# Altium project LSS_Gripper_Bottom_Board.PrjPcb (part 3 of 3)

## Sheet Motor-Driver-Sheet.SchDoc
size 420 x 297 mm; SheetNumber: 4; SheetTotal: 7
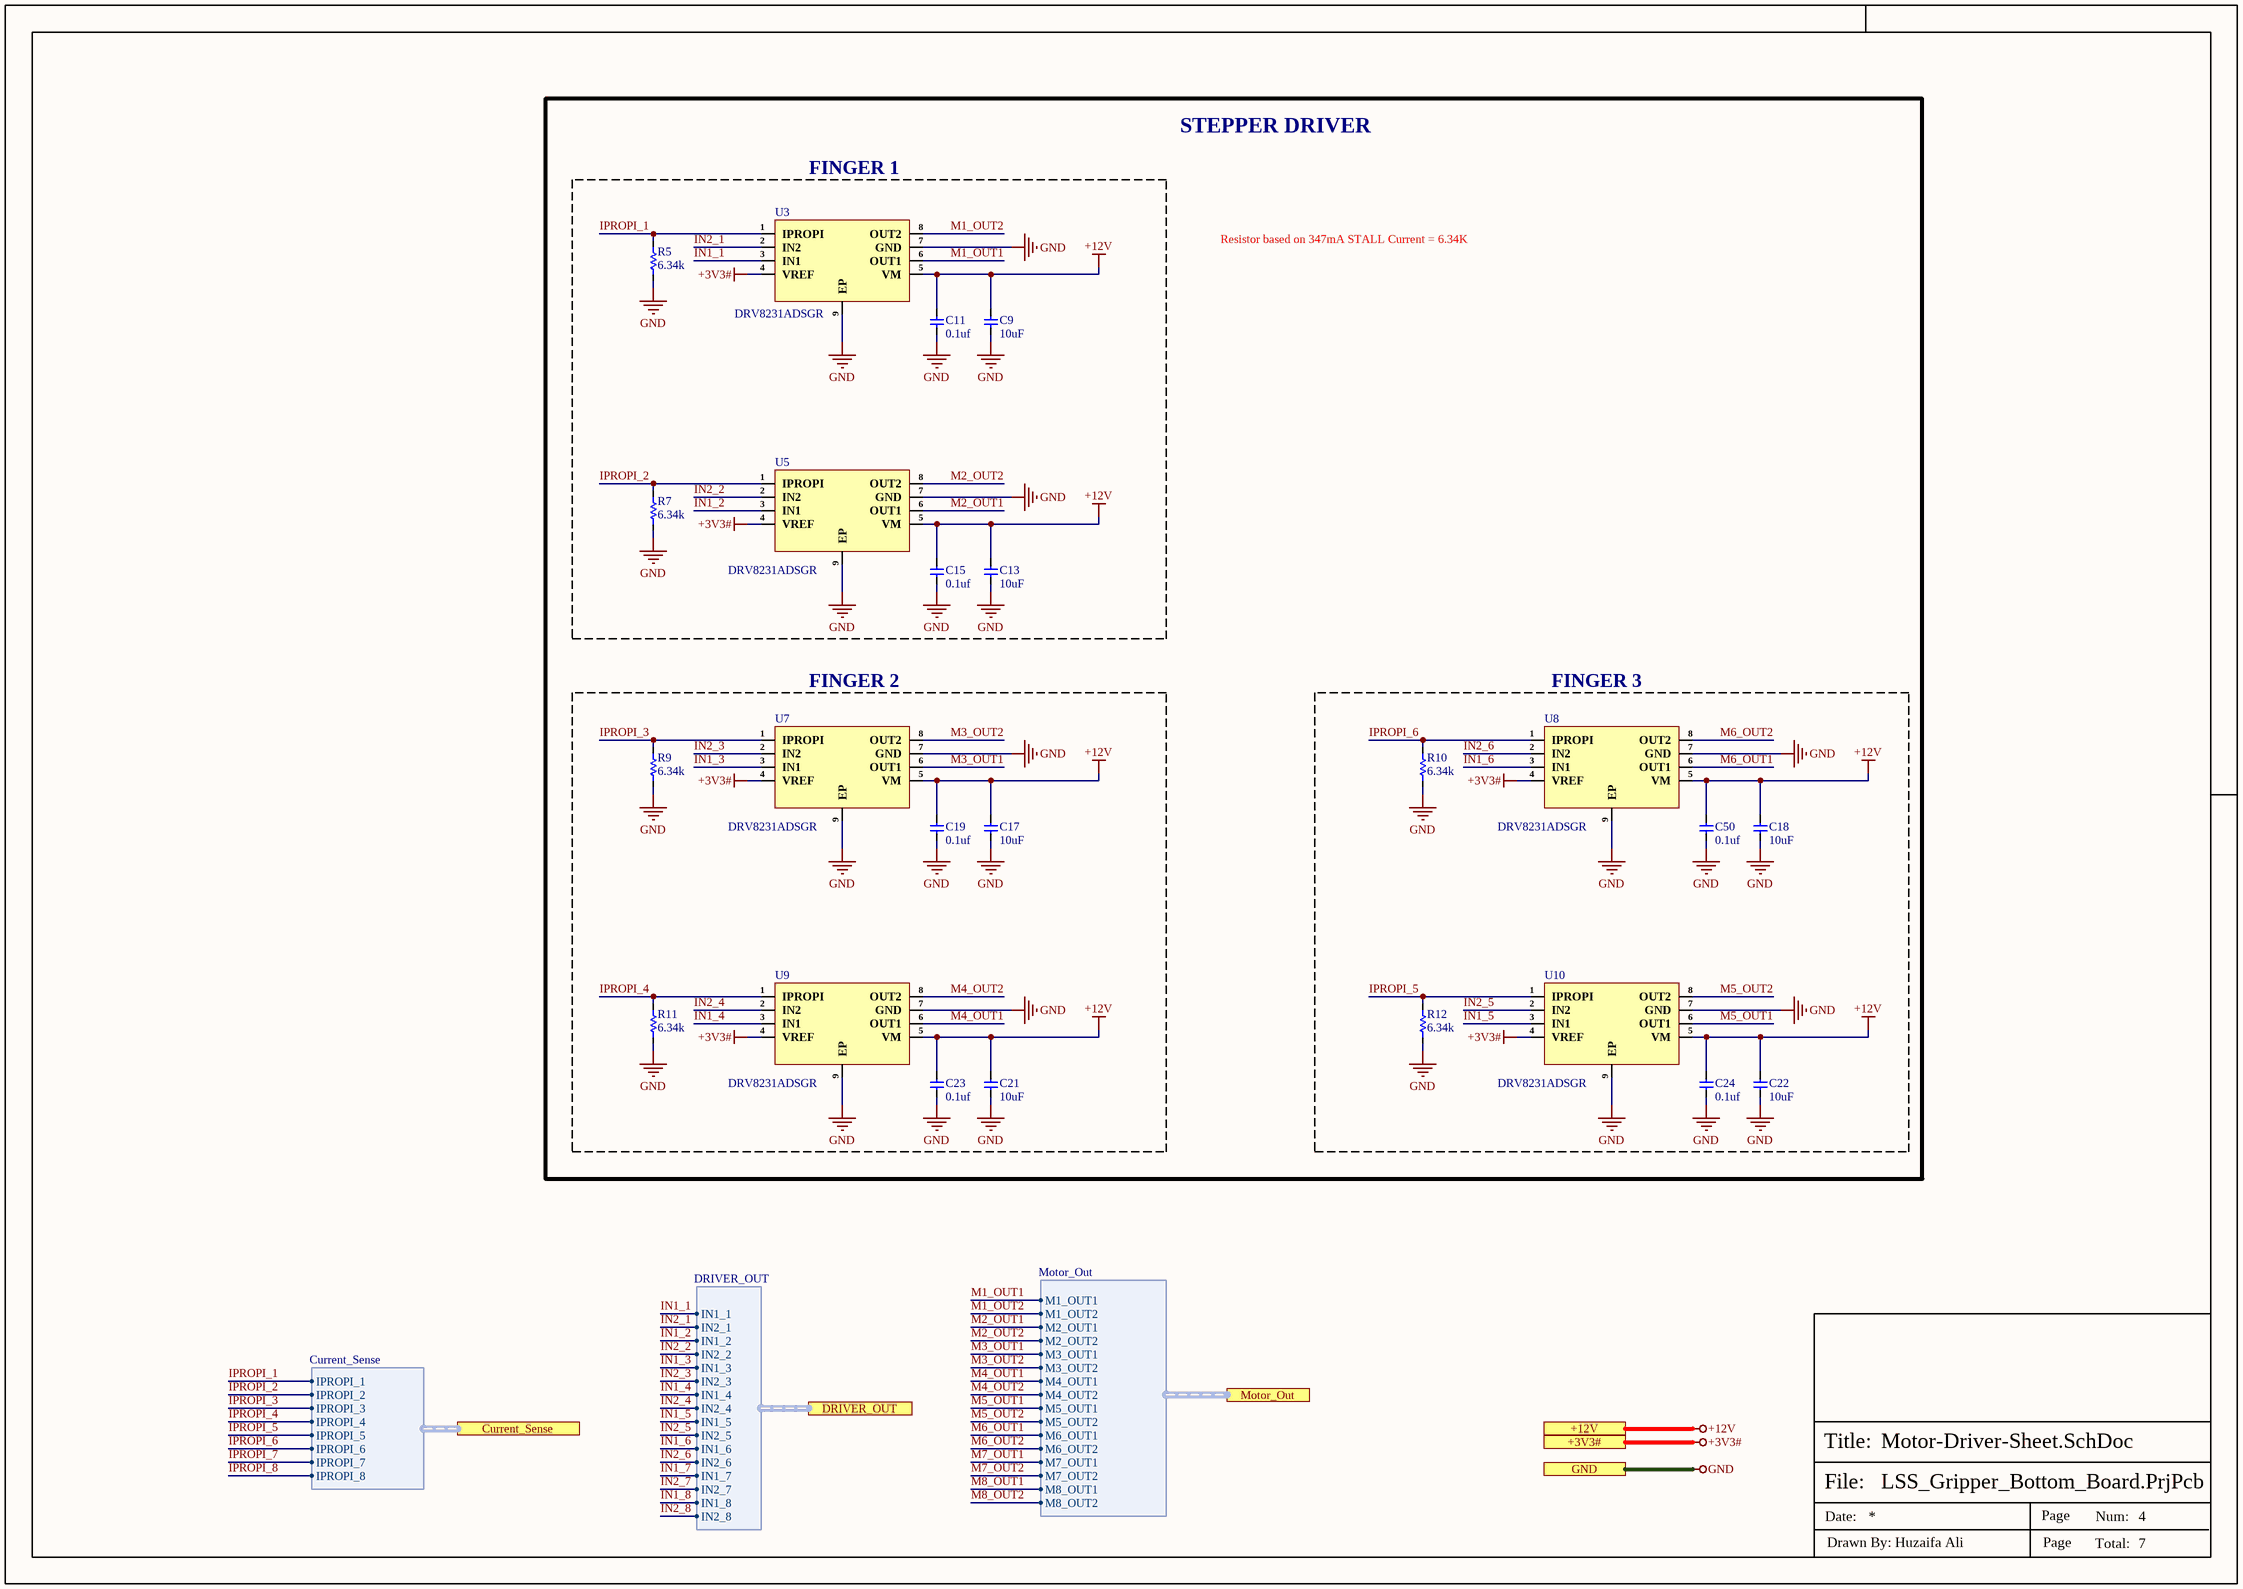
[diagram p6: Motor-Driver-Sheet.SchDoc]

### Parts
C9  10uF  [Cap-0603]
C11  0.1uf  [Cap-0402]
C13  10uF  [Cap-0603]
C15  0.1uf  [Cap-0402]
C17  10uF  [Cap-0603]
C18  10uF  [Cap-0603]
C19  0.1uf  [Cap-0402]
C21  10uF  [Cap-0603]
C22  10uF  [Cap-0603]
C23  0.1uf  [Cap-0402]
C24  0.1uf  [Cap-0402]
C50  0.1uf  [Cap-0402]
R5  6.34k  [Res-0603]
R7  6.34k  [Res-0603]
R9  6.34k  [Res-0603]
R10  6.34k  [Res-0603]
R11  6.34k  [Res-0603]
R12  6.34k  [Res-0603]
U3  DRV8231ADSGR  [WSON-8(2x2)]
U5  DRV8231ADSGR  [WSON-8(2x2)]
U7  DRV8231ADSGR  [WSON-8(2x2)]
U8  DRV8231ADSGR  [WSON-8(2x2)]
U9  DRV8231ADSGR  [WSON-8(2x2)]
U10  DRV8231ADSGR  [WSON-8(2x2)]

### Blocks framed on the sheet
FINGER 1: C9 C11 C13 C15 R5 R7 U3 U5
FINGER 2: C17 C19 C21 C23 R9 R11 U7 U9
FINGER 3: C18 C22 C24 C50 R10 R12 U8 U10

### Ports
+3V3# (see Top-Sheet[4B], CAN-Sheet[5D], Controller-Sheet[5D], Current-Sense-Sheet[5D]), +12V (see Top-Sheet[4B], Connector-Sheet[5D]), Current_Sense (harness Current_Sense, see Top-Sheet[5B], Current-Sense-Sheet[2D]), DRIVER_OUT (harness DRIVER_OUT, see Top-Sheet[4B], Controller-Sheet[2D]), GND (see Top-Sheet[4B], CAN-Sheet[5D], Connector-Sheet[5D], Controller-Sheet[5D], Current-Sense-Sheet[5D], Motor-Connector[5D]), Motor_Out (harness Motor_Out, see Top-Sheet[4B], Motor-Connector[4D])

### Harnesses
Current_Sense: IPROPI_1, IPROPI_2, IPROPI_3, IPROPI_4, IPROPI_5, IPROPI_6, IPROPI_7, IPROPI_8
Motor_Out: M1_OUT1, M1_OUT2, M2_OUT1, M2_OUT2, M3_OUT1, M3_OUT2, M4_OUT1, M4_OUT2, M5_OUT1, M5_OUT2, M6_OUT1, M6_OUT2, M7_OUT1, M7_OUT2, M8_OUT1, M8_OUT2
DRIVER_OUT: IN1_1, IN2_1, IN1_2, IN2_2, IN1_3, IN2_3, IN1_4, IN2_4, IN1_5, IN2_5, IN1_6, IN2_6, IN1_7, IN2_7, IN1_8, IN2_8

### Nets
+3V3#: U3.4(VREF) U5.4(VREF) U7.4(VREF) U8.4(VREF) U9.4(VREF) U10.4(VREF) ; port +3V3#
+12V: C9.2 C11.2 C13.2 C15.2 C17.2 C18.2 C19.2 C21.2 C22.2 C23.2 C24.2 C50.2 U3.5(VM) U5.5(VM) U7.5(VM) U8.5(VM) U9.5(VM) U10.5(VM) ; port +12V
GND: C9.1 C11.1 C13.1 C15.1 C17.1 C18.1 C19.1 C21.1 C22.1 C23.1 C24.1 C50.1 R5.1 R7.1 R9.1 R10.1 R11.1 R12.1 U3.7(GND) U3.9(EP) U5.7(GND) U5.9(EP) U7.7(GND) U7.9(EP) U8.7(GND) U8.9(EP) U9.7(GND) U9.9(EP) U10.7(GND) U10.9(EP) ; port GND
IPROPI_1: R5.2 U3.1(IPROPI) ; port Current_Sense.IPROPI_1
IPROPI_2: R7.2 U5.1(IPROPI) ; port Current_Sense.IPROPI_2
IPROPI_3: R9.2 U7.1(IPROPI) ; port Current_Sense.IPROPI_3
IPROPI_4: R11.2 U9.1(IPROPI) ; port Current_Sense.IPROPI_4
IPROPI_5: R12.2 U10.1(IPROPI) ; port Current_Sense.IPROPI_5
IPROPI_6: R10.2 U8.1(IPROPI) ; port Current_Sense.IPROPI_6
IN1_1: U3.3(IN1) ; port DRIVER_OUT.IN1_1
IN1_2: U5.3(IN1) ; port DRIVER_OUT.IN1_2
IN1_3: U7.3(IN1) ; port DRIVER_OUT.IN1_3
IN1_4: U9.3(IN1) ; port DRIVER_OUT.IN1_4
IN1_5: U10.3(IN1) ; port DRIVER_OUT.IN1_5
IN1_6: U8.3(IN1) ; port DRIVER_OUT.IN1_6
IN1_7: port DRIVER_OUT.IN1_7
IN1_8: port DRIVER_OUT.IN1_8
IN2_1: U3.2(IN2) ; port DRIVER_OUT.IN2_1
IN2_2: U5.2(IN2) ; port DRIVER_OUT.IN2_2
IN2_3: U7.2(IN2) ; port DRIVER_OUT.IN2_3
IN2_4: U9.2(IN2) ; port DRIVER_OUT.IN2_4
IN2_5: U10.2(IN2) ; port DRIVER_OUT.IN2_5
IN2_6: U8.2(IN2) ; port DRIVER_OUT.IN2_6
IN2_7: port DRIVER_OUT.IN2_7
IN2_8: port DRIVER_OUT.IN2_8
IPROPI_7: port Current_Sense.IPROPI_7
IPROPI_8: port Current_Sense.IPROPI_8
M1_OUT1: U3.6(OUT1) ; port Motor_Out.M1_OUT1
M1_OUT2: U3.8(OUT2) ; port Motor_Out.M1_OUT2
M2_OUT1: U5.6(OUT1) ; port Motor_Out.M2_OUT1
M2_OUT2: U5.8(OUT2) ; port Motor_Out.M2_OUT2
M3_OUT1: U7.6(OUT1) ; port Motor_Out.M3_OUT1
M3_OUT2: U7.8(OUT2) ; port Motor_Out.M3_OUT2
M4_OUT1: U9.6(OUT1) ; port Motor_Out.M4_OUT1
M4_OUT2: U9.8(OUT2) ; port Motor_Out.M4_OUT2
M5_OUT1: U10.6(OUT1) ; port Motor_Out.M5_OUT1
M5_OUT2: U10.8(OUT2) ; port Motor_Out.M5_OUT2
M6_OUT1: U8.6(OUT1) ; port Motor_Out.M6_OUT1
M6_OUT2: U8.8(OUT2) ; port Motor_Out.M6_OUT2
M7_OUT1: port Motor_Out.M7_OUT1
M7_OUT2: port Motor_Out.M7_OUT2
M8_OUT1: port Motor_Out.M8_OUT1
M8_OUT2: port Motor_Out.M8_OUT2

### Notes on the sheet
- STEPPER DRIVER
- Resistor based on 347mA STALL Current = 6.34K
- File:
- Title:
- Date:
- Page
- Num:
- Total:
- Drawn By: Huzaifa Ali

### Library data of the parts
C9 C13 C17 C18 C21 C22 = GRM188R61E106KA73D: CAP CER 10UF 25V X5R 0603; Manufacturer: Murata; Supplier 1: Mouser; Manufacturer Part Number: GRM188R61E106KA73D; RoHS: Yes; Category: Ceramic Capacitors; Stock 1: 319428; Pricing 1: 1=0.36000, 10=0.25800, 50=0.25800, 100=0.15500, 1000=0.09800, 10000=0.06900 (USD); Case/Package: 0603; RoHS Compliant: Yes; ComponentLink1URL: https://search.murata.co.jp/Ceramy/image/img/A01X/G101/ENG/GRM188R61E106KA73-01.pdf?src-supplier=Digi-Key; ComponentLink1Description: https://search.murata.co.jp/Ceramy/image/img/A01X/G101/ENG/GRM188R61E106KA73-01.pdf?src-supplier=Digi-Key; Supplier Part Number 1: 81-GRM188R61E106KA3D; LCSC Part Number: C344022
C11 C15 C19 C23 C24 C50 = GRM155R62A104KE14D: CAP CER 0.1UF 100V X5R 0402; Manufacturer: Murata; Capacitance: 100nF; Tolerance: 10%; Item Type: Capacitor; Supplier 1: Arrow Electronics; Manufacturer Part Number: GRM155R62A104KE14D; RoHS: Yes; Category: Ceramic Capacitors; Stock 1: 870000; Pricing 1: 10000=0.00500, 20000=0.00410, 30000=0.00390, 50000=0.00370, 100000=0.00300 (USD); Mount: Surface Mount; Case/Package: 0402; Case Code (Metric): 1005; Case Code (Imperial): 0402; Weight: 0.000212oz; Min Operating Temperature: -55°C; Max Operating Temperature: 85°C; Packaging: Tape and Reel; Voltage Rating: 100V; Dielectric: X5R; Termination: SMD/SMT; Voltage Rating (DC): 100V; Package Quantity: 10000; Series: GRM; Length: 0.039inch; Width: 0.02inch; Height: 0.5mm; Thickness: 0.022inch; Reach SVHC Compliant: Yes; Lead Free: Lead Free; RoHS Compliant: Yes; ComponentLink1URL: http://www.farnell.com/datasheets/2079151.pdf?src-supplier=Farnell; ComponentLink1Description: http://www.farnell.com/datasheets/2079151.pdf?src-supplier=Farnell; ComponentLink2URL: http://www.mouser.com/ds/2/281/c02e-2905.pdf?src-supplier=Mouser; ComponentLink2Description: http://www.mouser.com/ds/2/281/c02e-2905.pdf?src-supplier=Mouser; ComponentLink3URL: http://www.farnell.com/datasheets/2079151.pdf?src-supplier=Element14; ComponentLink3Description: http://www.farnell.com/datasheets/2079151.pdf?src-supplier=Element14; ComponentLink4URL: http://search.murata.co.jp/Ceramy/image/img/A01X/G101/ENG/GRM155R62A104KE14-01.pdf?src-supplier=Digi-Key; ComponentLink4Description: http://search.murata.co.jp/Ceramy/image/img/A01X/G101/ENG/GRM155R62A104KE14-01.pdf?src-supplier=Digi-Key; ComponentLink5URL: http://www.farnell.com/datasheets/2079151.pdf?src-supplier=Newark; ComponentLink5Description: http://www.farnell.com/datasheets/2079151.pdf?src-supplier=Newark; Supplier Part Number 1: GRM155R62A104KE14D; LCSC Part Number: C162178
R5 R7 R9-R12 = RT0603BRD076K34L: RES SMD 6.34KOHM 0.1% 1/10W 0603; Manufacturer: Yageo; Resistance: 6.34kR; Power Rating: 100mW; Voltage Rating: 75V; Temperature Coefficient: 25ppm/°C; Voltage Rating (DC): 50V; Item Type: Resistor; Supplier 1: Digi-Key; Manufacturer Part Number: RT0603BRD076K34L; RoHS: Yes; Category: Chip SMD Resistors; Stock 1: 15385; Pricing 1: 1=0.34000, 10=0.28800, 100=0.11260, 500=0.06812, 1000=0.04716, 2500=0.04322 (USD); Case/Package: 0603; Case Code (Imperial): 0603; Case Code (Metric): 1608; Weight: 7.1E-05oz; Min Operating Temperature: -55°C; Max Operating Temperature: 125°C; Packaging: Tape and Reel; Tolerance: 0.1%; Termination: SMD/SMT; Series: RT; Length: 1.6mm; Width: 0.8mm; Height: 0.45mm; Lead Free: Lead Free; RoHS Compliant: Yes; ComponentLink1URL: https://datasheet.ciiva.com/12811/pyu-rt-1-to-0-05-rohs-l-4-12811741.pdf?src-supplier=Mouser; ComponentLink1Description: https://datasheet.ciiva.com/12811/pyu-rt-1-to-0-05-rohs-l-4-12811741.pdf?src-supplier=Mouser; LCSC Part Number: C861532; Supplier Part Number 1: YAG4590CT-ND
U3 U5 U7-U10 = DRV8231ADSGR: 33V H BRIDGE MOTOR DRIVER WITH C; Manufacturer: Texas Instruments; Item Type: IC; Number of Channels: 1NUMBER; Supplier: Mouser; Supplier Part Number: 595-DRV8231ADSGR; Manufacturer Part Number: DRV8231ADSGR; RoHS: No; Stock: 8609; Pricing: 1=1.52, 10=1.29, 50=1.29, 100=1.1, 1000=0.747, 10000=0.657 (USD); Pins: 8NUMBER; Length: 2mm; Width: 2mm; Height: 800um; Thickness: 750um; LCSC Part Number: C5139865

## Nets that join several sheets
+3V3: Connector-Sheet (D17.2 J9.3 J15.1), Controller-Sheet (FB1.1)
+3V3#: CAN-Sheet (C49.2 R6.1 U16.5), Controller-Sheet (28 pins), Current-Sense-Sheet (12 pins), Motor-Driver-Sheet (6 pins)
+5V: Connector-Sheet (D15.2 J9.4), Motor-Connector (FB2.1)
+5V#: CAN-Sheet (C45.1 D34.2 U15.3), Motor-Connector (23 pins)
+12V: Connector-Sheet (D16.2 J9.1 J9.2), Motor-Driver-Sheet (18 pins)
GND: CAN-Sheet (7 pins), Connector-Sheet (20 pins), Controller-Sheet (64 pins), Current-Sense-Sheet (12 pins), Motor-Connector (22 pins), Motor-Driver-Sheet (30 pins)
IPROPI_1: Current-Sense-Sheet (U6.1), Motor-Driver-Sheet (R5.2 U3.1)
IPROPI_2: Current-Sense-Sheet (U11.1), Motor-Driver-Sheet (R7.2 U5.1)
IPROPI_3: Current-Sense-Sheet (U14.1), Motor-Driver-Sheet (R9.2 U7.1)
IPROPI_4: Current-Sense-Sheet (U12.1), Motor-Driver-Sheet (R11.2 U9.1)
IPROPI_5: Current-Sense-Sheet (U4.1), Motor-Driver-Sheet (R12.2 U10.1)
IPROPI_6: Current-Sense-Sheet (U13.1), Motor-Driver-Sheet (R10.2 U8.1)
ADC_1: Controller-Sheet (U2.24), Current-Sense-Sheet (U6.3 U6.4)
ADC_2: Controller-Sheet (U2.25), Current-Sense-Sheet (U11.3 U11.4)
ADC_3: Controller-Sheet (U2.26), Current-Sense-Sheet (U14.3 U14.4)
ADC_4: Controller-Sheet (U2.29), Current-Sense-Sheet (U12.3 U12.4)
ADC_5: Controller-Sheet (U2.30), Current-Sense-Sheet (U4.3 U4.4)
ADC_6: Controller-Sheet (U2.31), Current-Sense-Sheet (U13.3 U13.4)
CAN_NH#: CAN-Sheet (R21.1 U15.7), Connector-Sheet (D2.1 J11.4)
CAN_NH_MCU: CAN-Sheet (Q2.1), Controller-Sheet (U2.17)
CAN_NL#: CAN-Sheet (R20.1 U15.6), Connector-Sheet (D2.2 J11.5)
CAN_NL_MCU: CAN-Sheet (Q1.1), Controller-Sheet (U2.16)
CAN_RX: CAN-Sheet (U16.4), Controller-Sheet (D4.2 U2.81)
CAN_TX: CAN-Sheet (R6.2 U15.1), Controller-Sheet (D5.2 U2.82)
EN_1A: Controller-Sheet (D9.2 D39.2 U2.97), Motor-Connector (J1.5 J4.5)
EN_1B: Controller-Sheet (D10.2 D40.2 U2.98), Motor-Connector (J1.6 J4.6)
EN_2A: Controller-Sheet (D13.2 D37.2 U2.1), Motor-Connector (J5.5 J8.5)
EN_2B: Controller-Sheet (D14.2 D38.2 U2.2), Motor-Connector (J5.6 J8.6)
EN_3A: Controller-Sheet (D20.2 D41.2 U2.3), Motor-Connector (J2.5 J12.5)
EN_3B: Controller-Sheet (D21.2 D42.2 U2.4), Motor-Connector (J2.6 J12.6)
EN_4A: Controller-Sheet (D6.2 D24.2 U2.5), Motor-Connector (J6.5 J13.5)
EN_4B: Controller-Sheet (D25.2 D35.2 U2.38), Motor-Connector (J6.6 J13.6)
EN_5A: Controller-Sheet (D28.2 U2.39), Motor-Connector (J3.5)
EN_5B: Controller-Sheet (D29.2 U2.40), Motor-Connector (J3.6)
EN_6A: Controller-Sheet (D32.2 U2.41), Motor-Connector (J7.5)
EN_6B: Controller-Sheet (D33.2 U2.42), Motor-Connector (J7.6)
IN1_1: Controller-Sheet (D7.2 U2.83), Motor-Driver-Sheet (U3.3)
IN1_2: Controller-Sheet (D11.2 U2.85), Motor-Driver-Sheet (U5.3)
IN1_3: Controller-Sheet (D18.2 U2.87), Motor-Driver-Sheet (U7.3)
IN1_4: Controller-Sheet (D22.2 U2.55), Motor-Driver-Sheet (U9.3)
IN1_5: Controller-Sheet (D26.2 U2.57), Motor-Driver-Sheet (U10.3)
IN1_6: Controller-Sheet (D30.2 U2.59), Motor-Driver-Sheet (U8.3)
IN2_1: Controller-Sheet (D8.2 U2.84), Motor-Driver-Sheet (U3.2)
IN2_2: Controller-Sheet (D12.2 U2.86), Motor-Driver-Sheet (U5.2)
IN2_3: Controller-Sheet (D19.2 U2.88), Motor-Driver-Sheet (U7.2)
IN2_4: Controller-Sheet (D23.2 U2.56), Motor-Driver-Sheet (U9.2)
IN2_5: Controller-Sheet (D27.2 U2.58), Motor-Driver-Sheet (U10.2)
IN2_6: Controller-Sheet (D31.2 U2.60), Motor-Driver-Sheet (U8.2)
M1_OUT1: Motor-Connector (J1.1 J4.1), Motor-Driver-Sheet (U3.6)
M1_OUT2: Motor-Connector (J1.2 J4.2), Motor-Driver-Sheet (U3.8)
M2_OUT1: Motor-Connector (J5.1 J8.1), Motor-Driver-Sheet (U5.6)
M2_OUT2: Motor-Connector (J5.2 J8.2), Motor-Driver-Sheet (U5.8)
M3_OUT1: Motor-Connector (J2.1 J12.1), Motor-Driver-Sheet (U7.6)
M3_OUT2: Motor-Connector (J2.2 J12.2), Motor-Driver-Sheet (U7.8)
M4_OUT1: Motor-Connector (J6.1 J13.1), Motor-Driver-Sheet (U9.6)
M4_OUT2: Motor-Connector (J6.2 J13.2), Motor-Driver-Sheet (U9.8)
M5_OUT1: Motor-Connector (J3.1), Motor-Driver-Sheet (U10.6)
M5_OUT2: Motor-Connector (J3.2), Motor-Driver-Sheet (U10.8)
M6_OUT1: Motor-Connector (J7.1), Motor-Driver-Sheet (U8.6)
M6_OUT2: Motor-Connector (J7.2), Motor-Driver-Sheet (U8.8)
NRST: Connector-Sheet (J15.4), Controller-Sheet (C2.2 R4.1 U2.14)
STB: CAN-Sheet (R8.2 U15.8), Controller-Sheet (U2.15)
SWCLK: Connector-Sheet (J15.3), Controller-Sheet (U2.76)
SWDIO: Connector-Sheet (J15.2), Controller-Sheet (U2.72)
USB_N: Connector-Sheet (D1.1 J14.A7 J14.B7), Controller-Sheet (U2.70)
USB_P: Connector-Sheet (D1.2 J14.A6 J14.B6), Controller-Sheet (U2.71)